# Altium schematic sheet Audio.SchDoc
size A4; SheetNumber: 2; SheetTotal: 7
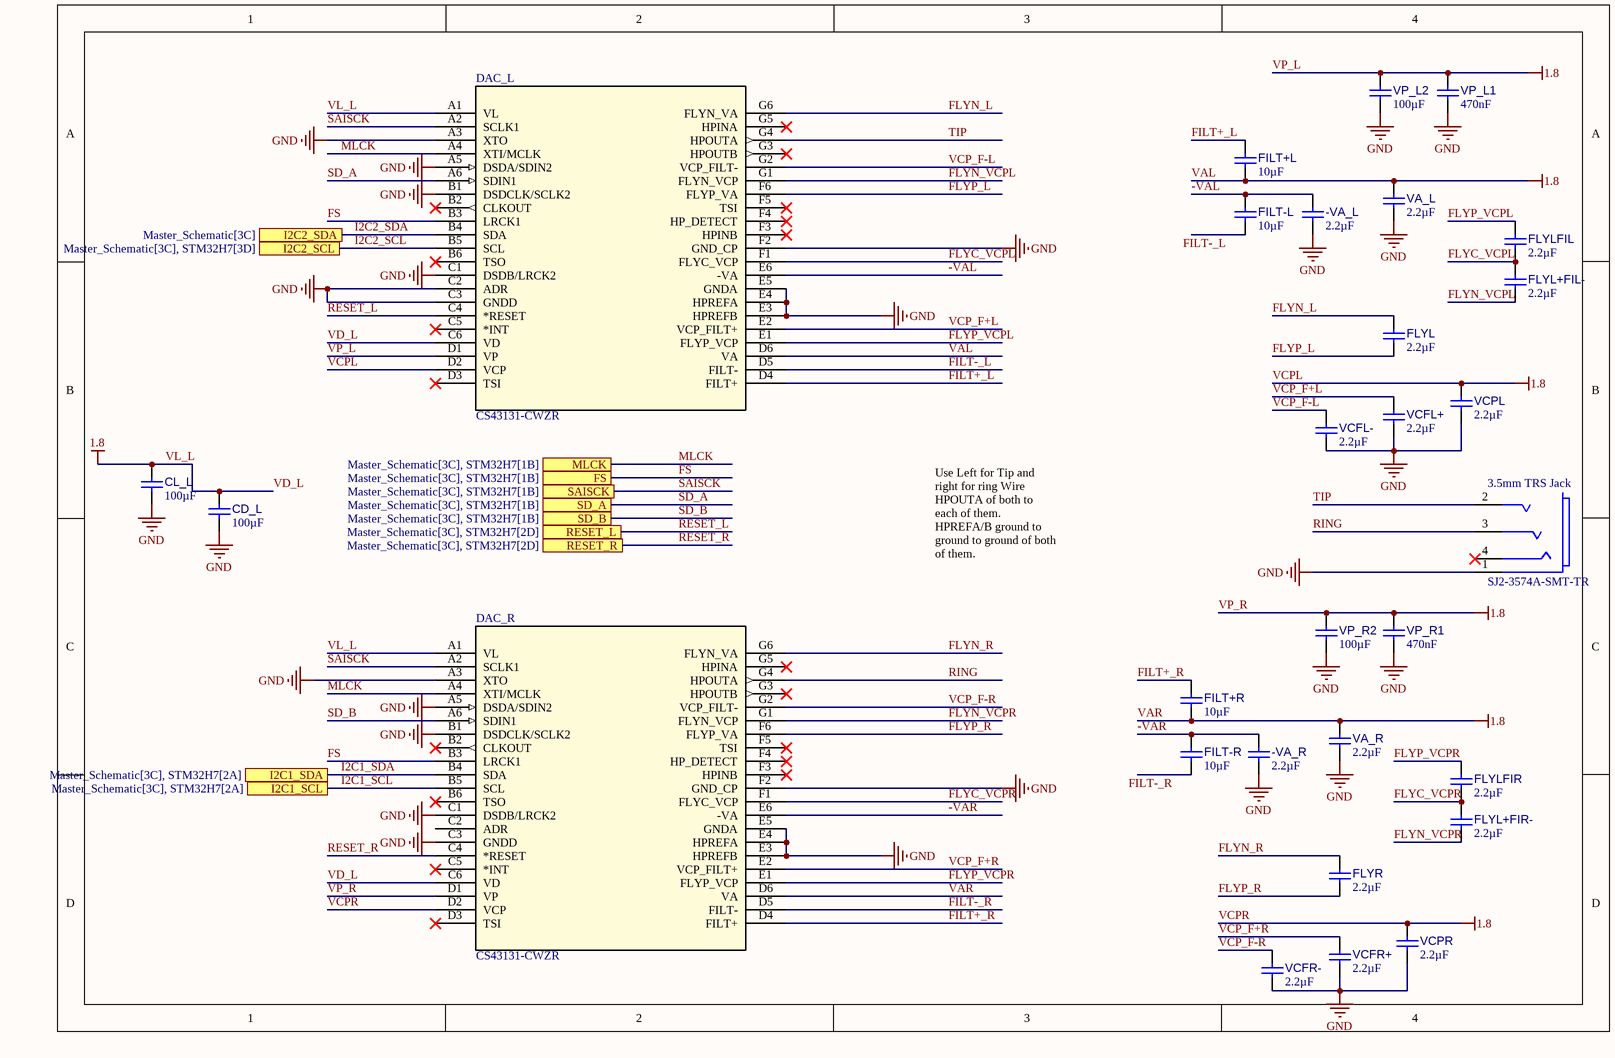
[diagram p0: Audio.SchDoc]

## Parts
3.5mm_TRS_Jack  SJ2-3574A-SMT-TR  [FP-SJ2-3574A-SMT-TR-MFG]
-VA_L  value 2.2µF  [CAPC0402(1005)60_L]  (hidden comment: Capacitor 2,2µF +/-20% 10V 0402)
-VA_R  value 2.2µF  [CAPC0402(1005)60_L]  (hidden comment: Capacitor 2,2µF +/-20% 10V 0402)
CD_L  value 100µF  [CAPC3216X190X55LL30T25]  (hidden comment: Capacitor 100 uF +/- 20% 6.3 V 1206)
CL_L  value 100µF  [CAPC3216X190X55LL30T25]  (hidden comment: Capacitor 100 uF +/- 20% 6.3 V 1206)
DAC_L  CS43131-CWZR  [WLCSP42_CS43131-CWZR_CIR]
DAC_R  CS43131-CWZR  [WLCSP42_CS43131-CWZR_CIR]
FILT+L  value 10µF  [CAPC0603(1608)100_L]  (hidden comment: Capacitor 10µF +/-20% 10V 0603)
FILT+R  value 10µF  [CAPC0603(1608)100_L]  (hidden comment: Capacitor 10µF +/-20% 10V 0603)
FILT-L  value 10µF  [CAPC0603(1608)100_L]  (hidden comment: Capacitor 10µF +/-20% 10V 0603)
FILT-R  value 10µF  [CAPC0603(1608)100_L]  (hidden comment: Capacitor 10µF +/-20% 10V 0603)
FLYL  value 2.2µF  [CAPC0402(1005)60_L]  (hidden comment: Capacitor 2,2µF +/-20% 10V 0402)
FLYL+FIL-  value 2.2µF  [CAPC0402(1005)60_L]  (hidden comment: Capacitor 2,2µF +/-20% 10V 0402)
FLYL+FIR-  value 2.2µF  [CAPC0402(1005)60_L]  (hidden comment: Capacitor 2,2µF +/-20% 10V 0402)
FLYLFIL  value 2.2µF  [CAPC0402(1005)60_L]  (hidden comment: Capacitor 2,2µF +/-20% 10V 0402)
FLYLFIR  value 2.2µF  [CAPC0402(1005)60_L]  (hidden comment: Capacitor 2,2µF +/-20% 10V 0402)
FLYR  value 2.2µF  [CAPC0402(1005)60_L]  (hidden comment: Capacitor 2,2µF +/-20% 10V 0402)
VA_L  value 2.2µF  [CAPC0402(1005)60_L]  (hidden comment: Capacitor 2,2µF +/-20% 10V 0402)
VA_R  value 2.2µF  [CAPC0402(1005)60_L]  (hidden comment: Capacitor 2,2µF +/-20% 10V 0402)
VCFL+  value 2.2µF  [CAPC0402(1005)60_L]  (hidden comment: Capacitor 2,2µF +/-20% 10V 0402)
VCFL-  value 2.2µF  [CAPC0402(1005)60_L]  (hidden comment: Capacitor 2,2µF +/-20% 10V 0402)
VCFR+  value 2.2µF  [CAPC0402(1005)60_L]  (hidden comment: Capacitor 2,2µF +/-20% 10V 0402)
VCFR-  value 2.2µF  [CAPC0402(1005)60_L]  (hidden comment: Capacitor 2,2µF +/-20% 10V 0402)
VCPL  value 2.2µF  [CAPC0402(1005)60_L]  (hidden comment: Capacitor 2,2µF +/-20% 10V 0402)
VCPR  value 2.2µF  [CAPC0402(1005)60_L]  (hidden comment: Capacitor 2,2µF +/-20% 10V 0402)
VP_L1  value 470nF  [CAPC0402(1005)60_L]  (hidden comment: Capacitor 470nF +/-40% 10V 0402)
VP_L2  value 100µF  [CAPC3216X190X55LL30T25]  (hidden comment: Capacitor 100 uF +/- 20% 6.3 V 1206)
VP_R1  value 470nF  [CAPC0402(1005)60_L]  (hidden comment: Capacitor 470nF +/-40% 10V 0402)
VP_R2  value 100µF  [CAPC3216X190X55LL30T25]  (hidden comment: Capacitor 100 uF +/- 20% 6.3 V 1206)

## Ports
FS (see Master_Schematic[3C], STM32H7[1B]), I2C1_SCL (see Master_Schematic[3C], STM32H7[2A]), I2C1_SDA (see Master_Schematic[3C], STM32H7[2A]), I2C2_SCL (see Master_Schematic[3C], STM32H7[3D]), I2C2_SDA (see Master_Schematic[3C]), MLCK (see Master_Schematic[3C], STM32H7[1B]), RESET_L (see Master_Schematic[3C], STM32H7[2D]), RESET_R (see Master_Schematic[3C], STM32H7[2D]), SAISCK (see Master_Schematic[3C], STM32H7[1B]), SD_A (see Master_Schematic[3C], STM32H7[1B]), SD_B (see Master_Schematic[3C], STM32H7[1B])

## Nets
GND: 3.5mm_TRS_Jack.1(sleeve) -VA_L.1 -VA_R.1 CD_L.1 CL_L.1 DAC_L.A3(XTO) DAC_L.A5(DSDA/SDIN2) DAC_L.B1(DSDCLK/SCLK2) DAC_L.C1(DSDB/LRCK2) DAC_L.C2(ADR) DAC_L.C3(GNDD) DAC_L.E3(HPREFB) DAC_L.E4(HPREFA) DAC_L.E5(GNDA) DAC_L.F2(GND_CP) DAC_R.A3(XTO) DAC_R.A5(DSDA/SDIN2) DAC_R.B1(DSDCLK/SCLK2) DAC_R.C1(DSDB/LRCK2) DAC_R.C3(GNDD) DAC_R.E3(HPREFB) DAC_R.E4(HPREFA) DAC_R.E5(GNDA) DAC_R.F2(GND_CP) VA_L.1 VA_R.1 VCFL+.1 VCFL-.1 VCFR+.1 VCFR-.1 VCPL.1 VCPR.1 VP_L1.1 VP_L2.1 VP_R1.1 VP_R2.1
VAL: CD_L.2 CL_L.2 DAC_L.A1(VL) DAC_L.C6(VD) DAC_L.D1(VP) DAC_L.D2(VCP) DAC_L.D6(VA) DAC_R.A1(VL) DAC_R.C6(VD) DAC_R.D1(VP) DAC_R.D2(VCP) DAC_R.D6(VA) FILT+L.2 FILT+R.2 VA_L.2 VA_R.2 VCPL.2 VCPR.2 VP_L1.2 VP_L2.2 VP_R1.2 VP_R2.2  [also labelled 1.8, VAR, VCPL, VCPR, VD_L, VL_L, VP_L, VP_R]
-VAL: -VA_L.2 DAC_L.E6(-VA) FILT-L.1
-VAR: -VA_R.2 DAC_R.E6(-VA) FILT-R.1
FILT+_L: DAC_L.D4(FILT+) FILT+L.1
FILT+_R: DAC_R.D4(FILT+) FILT+R.1
FILT-_L: DAC_L.D5(FILT-) FILT-L.2
FILT-_R: DAC_R.D5(FILT-) FILT-R.2
FLYC_VCPL: DAC_L.F1(FLYC_VCP) FLYL+FIL-.2 FLYLFIL.1
FLYC_VCPR: DAC_R.F1(FLYC_VCP) FLYL+FIR-.2 FLYLFIR.1
FLYN_L: DAC_L.G6(FLYN_VA) FLYL.2
FLYN_R: DAC_R.G6(FLYN_VA) FLYR.2
FLYN_VCPL: DAC_L.G1(FLYN_VCP) FLYL+FIL-.1
FLYN_VCPR: DAC_R.G1(FLYN_VCP) FLYL+FIR-.1
FLYP_L: DAC_L.F6(FLYP_VA) FLYL.1
FLYP_R: DAC_R.F6(FLYP_VA) FLYR.1
FLYP_VCPL: DAC_L.E1(FLYP_VCP) FLYLFIL.2
FLYP_VCPR: DAC_R.E1(FLYP_VCP) FLYLFIR.2
FS: DAC_L.B3(LRCK1) DAC_R.B3(LRCK1) ; port FS
I2C1_SCL: DAC_R.B5(SCL) ; port I2C1_SCL
I2C1_SDA: DAC_R.B4(SDA) ; port I2C1_SDA
I2C2_SCL: DAC_L.B5(SCL) ; port I2C2_SCL
I2C2_SDA: DAC_L.B4(SDA) ; port I2C2_SDA
MLCK: DAC_L.A4(XTI/MCLK) DAC_R.A4(XTI/MCLK) ; port MLCK
RESET_L: DAC_L.C4(*RESET) ; port RESET_L
RESET_R: DAC_R.C4(*RESET) ; port RESET_R
RING: 3.5mm_TRS_Jack.3(ring_1) DAC_R.G4(HPOUTA)
SAISCK: DAC_L.A2(SCLK1) DAC_R.A2(SCLK1) ; port SAISCK
SD_A: DAC_L.A6(SDIN1) ; port SD_A
SD_B: DAC_R.A6(SDIN1) ; port SD_B
TIP: 3.5mm_TRS_Jack.2(tip) DAC_L.G4(HPOUTA)
VCP_F+L: DAC_L.E2(VCP_FILT+) VCFL+.2
VCP_F+R: DAC_R.E2(VCP_FILT+) VCFR+.2
VCP_F-L: DAC_L.G2(VCP_FILT-) VCFL-.2
VCP_F-R: DAC_R.G2(VCP_FILT-) VCFR-.2

Not connected (* = marked no-connect by the designer): 3.5mm_TRS_Jack 4(ring_2)*; DAC_L B2(CLKOUT)* B6(TSO)* C5(*INT)* D3(TSI)* F3(HPINB)* F4(HP_DETECT)* F5(TSI)* G3(HPOUTB)* G5(HPINA)*; DAC_R B2(CLKOUT)* B6(TSO)* C2(ADR) C5(*INT)* D3(TSI)* F3(HPINB)* F4(HP_DETECT)* F5(TSI)* G3(HPOUTB)* G5(HPINA)*

## Notes on the sheet
- Use Left for Tip and right for ring Wire HPOUTA of both to each of them. HPREFA/B ground to ground to ground of both of them.

## Library data of the parts
3.5mm_TRS_Jack = CMP-14818-000001-1: AUDIO JACK, 3.5 MM, RT, 4 CONDUC; Manufacturer: CUI; Conn Orientation: Horizontal; Current Rating: 1A; Number Of Contacts: 4; Voltage Rating: 12V; Package: SJ2-3574A-SMT-TR; Device Class L1: Connectors; Lead Free: Yes; Digikey Description: AUDIO JACK, 3.5 MM, RT, 4 CONDUC; Device Class L2: Audio / Video Connectors; ComponentLink2URL: https://www.cui.com/product/resource/sj2-357x-smt.pdf; Automotive: No; RoHS: TRUE; Height: 5.3mm; Temperature Range Low: -25°C; Category: Conn; Temperature: -25°C to +85°C; Octopart: https://octopart.com/sj2-3574a-smt-tr-cui-77838840; Device Class L3: unset; Contact Material: Silver; Manufacturer Part Number: SJ2-3574A-SMT-TR; Temperature Range High: +85°C; ComponentLink2Description: Datasheet
-VA_L -VA_R FLYL FLYL+FIL- FLYL+FIR- FLYLFIL FLYLFIR FLYR VA_L VA_R VCFL+ VCFL- VCFR+ VCFR- VCPL VCPR = CMP-001-00056-4: Chip Capacitor, 2,2µF +/-20%, 10V, 0402, Thickness 0.6 mm; Tolerance: 10%; Mounting Technology: SMT; Max Operating Temperature: 85°C; Case/Package: 0402; Pins: 2; Min Operating Temperature: -55°C; Voltage Rating: 10V
CD_L CL_L VP_L2 VP_R2 = CMP-001-00019-6: Chip Capacitor, 100 uF, +/- 20%, 6.3 V, 1206 (3216 Metric); Voltage Rating: 6.3V; Capacitor Type: Ceramic; Tolerance: 20%; Pins: 2; Case/Package: 1206; Max Operating Temperature: 85°C; RoHS Compliant: True; Mounting Technology: SM; Min Operating Temperature: -55°C
DAC_L DAC_R = CMP-057-000000-1: Description; Manufacturer_Name: Cirrus Logic; Design Item ID: CS43131-CWZR; RefDes: RefDes; Source: CS43131-CWZR.SchLib; Manufacturer_Part_Number: CS43131-CWZR; Type: Type; Copyright: Copyright (C) 2025 Ultra Librarian. All rights reserved.
FILT+L FILT+R FILT-L FILT-R = CMP-001-00075-4: Chip Capacitor, 10µF +/-20%, 10V, 0603, Thickness 1 mm; Tolerance: 10%; Voltage Rating: 10V; Max Operating Temperature: 85°C; Pins: 2; Case/Package: 0603; Mounting Technology: SMT; Min Operating Temperature: -55°C
VP_L1 VP_R1 = CMP-001-00060-4: Chip Capacitor, 470nF +/-40%, 10V, 0402, Thickness 0.6 mm; Tolerance: 20%; Max Operating Temperature: 85°C; Case/Package: 0402; Voltage Rating: 10V; Min Operating Temperature: -55°C; Mounting Technology: SMT; Pins: 2